# Altium schematic sheet Sheet3_Buck.SchDoc
size A4; SheetNumber: 4; SheetTotal: 6
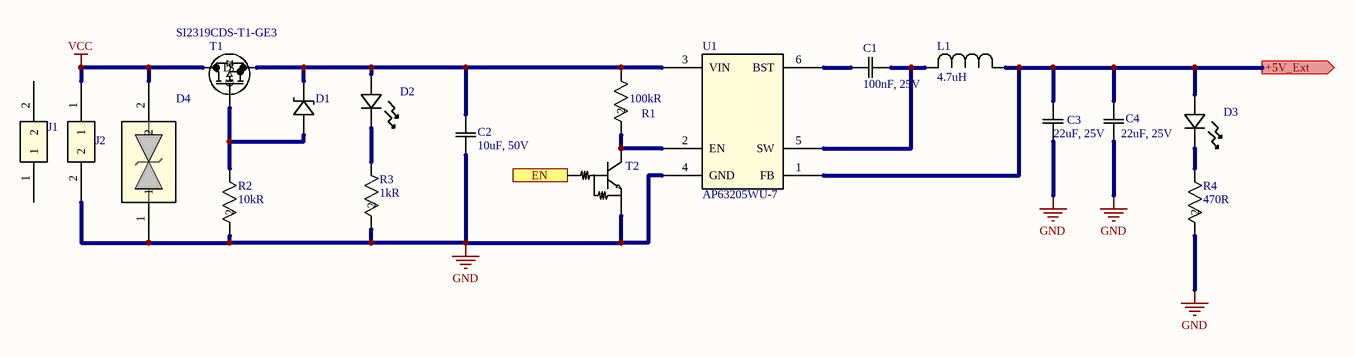
[diagram p0: Sheet3_Buck.SchDoc]

## Parts
?  (no value)  (graphical)
C1  100nF, 25V  [CAP_CL21_SAM]
C2  10uF, 50V  [CAP_CL31_SAM]
C3  22uF, 25V  [CAP_CL_21_SAM]
C4  22uF, 25V  [CAP_CL_21_SAM]
D1  MMSZ5246B-TP  [ZDO_SOD123_MCC]  (value not drawn)
D2  LTST-C170TBKT  [LED_LTST-C170_DIO]  (value not drawn)
D3  LTST-C170TBKT  [LED_LTST-C170_DIO]  (value not drawn)
D4  SMBJ6.0CA-TR  [SMB_BI_STM]  (value not drawn)
J1  TSW-101-07-G-D  [TSW-101-07-G-D_SAI]  (value not drawn)
J2  TSW-101-07-G-D  [CONN_1844210_PXC]  (value not drawn)
L1  4.7uH  [IND_TAIYO_NRS8040_TAY]
R1  100kR  [RES0805_CRG_TYCO_TYC]
R2  10kR  [RES0805_CRG_TYCO_TYC]
R3  1kR  [RES0805_CRG_TYCO_TYC]
R4  470R  [RC0805N_VIS]
T1  SI2319CDS-T1-GE3  [SOT-23-3_TO-236_VIS]
T2  RN1103(TE85L,F)  [SSM_TOS]  (value not drawn)
U1  AP63205WU-7  [SOIC_05WU-7_DIO]

## Ports
+5V_Ext (out, see Sheet2_Hierarquia[1B], Sheet4_Carregador_Bateria[1B], Sheet6_Power_Path[2A]), EN (in, see Sheet2_Hierarquia[1B], Sheet6_Power_Path[2D])

## Nets
GND: C2.1 C3.1 C4.1 D4.1 J2.2 R2.2 R3.2 R4.2 T2.2(E) U1.4(GND)
VCC: D4.2 J2.1 T1.3(D)
+5V_Ext: C3.2 C4.2 D3.2(ANODE) L1.1 U1.1(FB) ; port +5V_Ext
EN: T2.1(B) ; port EN
NetC1_1: C1.1 U1.6(BST)
NetC1_2: C1.2 L1.2 U1.5(SW)
NetC2_2: C2.2 D1.1 D2.2(ANODE) R1.1 T1.2(S) U1.3(VIN)
NetD1_2: D1.2 R2.1 T1.1(G)
NetD2_1: D2.1(KATHODE) R3.1
NetD3_1: D3.1(KATHODE) R4.1
NetR1_2: R1.2 T2.3(C) U1.2(EN)

Not connected (* = marked no-connect by the designer): J1 1 2

## Notes on the sheet
- Título:
- Endereço:
- Rua Aprígio Veloso, 1500 - Bodocongó
  CEP:58.429-140
  Campina Grande, Paraíba
  Brasil
- Projeto:
- Conta:
- Projetista:
- Arquivo:
- Data:
- Revisor:
- Pág.:
- Rev.:
- de

## Library data of the parts
? = Title Block
C1 = CL21B104KACNNNC: Description; Manufacturer_Name: Samsung; Copyright: Copyright (C) 2025 Ultra Librarian. All rights reserved.; Manufacturer_Part_Number: CL21B104KACNNNC
C2 = CL31A106KBHNNNE: Description; Manufacturer_Name: Samsung; Copyright: Copyright (C) 2025 Ultra Librarian. All rights reserved.; Manufacturer_Part_Number: CL31A106KBHNNNE
C3 C4 = CL21A226MAYNNNE: Description; Manufacturer_Name: Samsung; Copyright: Copyright (C) 2025 Ultra Librarian. All rights reserved.; Manufacturer_Part_Number: CL21A226MAYNNNE
D1 = MMSZ5246B-TP: DIODE ZENER 16V 500MW SOD123; Manufacturer_Name: MCC; Copyright: Copyright (C) 2026 Ultra Librarian. All rights reserved.; Manufacturer_Part_Number: MMSZ5246B-TP
D2 D3 = LTST-C170TBKT: No Description Available; Manufacturer_Name: Diodes Inc; Copyright: Copyright (C) 2026 Ultra Librarian. All rights reserved.; Manufacturer_Part_Number: LTST-C170TBKT
D4 = SMBJ6.0CA-TR: 600 W, 6 V TVS in SMB; Manufacturer_Name: STMicroelectronics; Copyright: Copyright (C) 2026 Ultra Librarian. All rights reserved.; Manufacturer_Part_Number: SMBJ6.0CA-TR; Datasheet: https://www.st.com/resource/en/datasheet/smbj58ca.pdf; RefDes: RefDes; Type: Type
J1 J2 = TSW-101-07-G-D: No Description Available; Manufacturer_Name: Samtec Inc; Copyright: Copyright (C) 2026 Ultra Librarian. All rights reserved.; Manufacturer_Part_Number: TSW-101-07-G-D; RefDes: RefDes; Type: Type
L1 = NRS8040T4R7NJGJ: No Description Available; Manufacturer_Name: TAIYO YUDEN; Copyright: Copyright (C) 2026 Ultra Librarian. All rights reserved.; Manufacturer_Part_Number: NRS8040T4R7NJGJ
R1 = CRG0805F100K: CRG0805 1% 100K; Manufacturer_Name: TE Connectivity; Copyright: Copyright (C) 2026 Ultra Librarian. All rights reserved.; Manufacturer_Part_Number: CRG0805F100K; Datasheet: https://www.te.com/commerce/DocumentDelivery/DDEController?Action=srchrtrv&DocNm=1773204&DocType=Data+Sheet&DocLang=English&PartCntxt=1623095-1&DocFormat=pdf
R2 = CRG0805F10K: CRG0805 1% 10K; Manufacturer_Name: TE Connectivity; Copyright: Copyright (C) 2026 Ultra Librarian. All rights reserved.; Manufacturer_Part_Number: CRG0805F10K
R3 = CRG0805F1K0: CRG0805 1% 1K0; Manufacturer_Name: TE Connectivity; Copyright: Copyright (C) 2026 Ultra Librarian. All rights reserved.; Manufacturer_Part_Number: CRG0805F1K0; Datasheet: https://www.te.com/commerce/DocumentDelivery/DDEController?Action=srchrtrv&DocNm=1773204&DocType=Data+Sheet&DocLang=English&PartCntxt=1623131-1&DocFormat=pdf
R4 = CRCW0805470RJNEA: No Description Available; Manufacturer_Name: Vishay; Copyright: Copyright (C) 2026 Ultra Librarian. All rights reserved.; Manufacturer_Part_Number: CRCW0805470RJNEA; Datasheet: https://www.vishay.com/doc?20035
T1 = SI2319CDS-T1-GE3: P-CHANNEL 40-V (D-S) MOSFET; Manufacturer_Name: Vishay; Copyright: Copyright (C) 2026 Ultra Librarian. All rights reserved.; Manufacturer_Part_Number: SI2319CDS-T1-GE3; Datasheet: https://www.vishay.com/doc?66709
T2 = RN1103TE85L,F: No Description Available; Manufacturer_Name: Toshiba Electronic Devices & Storage Corp.; Copyright: Copyright (C) 2026 Ultra Librarian. All rights reserved.; Manufacturer_Part_Number: RN1103(TE85L,F); RefDes: Refdes; Type: Type
U1 = AP63205WU-7: Description; Manufacturer_Name: Diodes Inc; Copyright: Copyright (C) 2025 Ultra Librarian. All rights reserved.; Manufacturer_Part_Number: AP63205WU-7; RefDes: RefDes; Type: Type